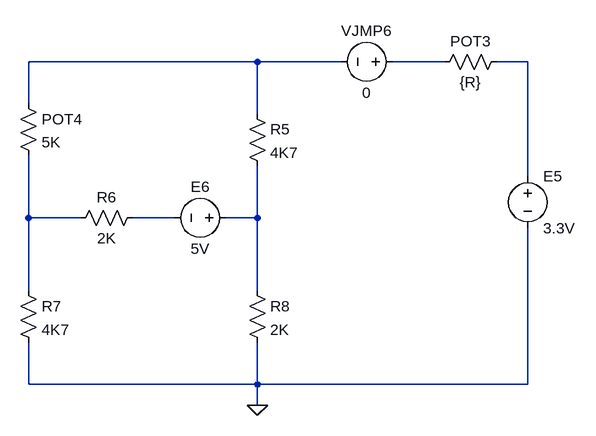
[diagram p0: schematic bai33.asc]
bai33.asc, the LTspice schematic file:
Version 4.1
SHEET 1 880 680
WIRE 144 -240 -208 -240
WIRE 272 -240 144 -240
WIRE 432 -240 352 -240
WIRE 560 -240 512 -240
WIRE -208 -176 -208 -240
WIRE 144 -160 144 -240
WIRE 560 -64 560 -240
WIRE -208 0 -208 -96
WIRE -128 0 -208 0
WIRE 16 0 -48 0
WIRE 144 0 144 -80
WIRE 144 0 96 0
WIRE -208 112 -208 0
WIRE 144 112 144 0
WIRE -208 256 -208 192
WIRE 144 256 144 192
WIRE 144 256 -208 256
WIRE 560 256 560 16
WIRE 560 256 144 256
WIRE 144 288 144 256
FLAG 144 288 0
SYMBOL res -224 -192 R0
SYMATTR InstName POT4
SYMATTR Value 5K
SYMBOL res 128 -176 R0
SYMATTR InstName R5
SYMATTR Value 4K7
SYMBOL res -32 -16 R90
WINDOW 0 0 56 VBottom 2
WINDOW 3 32 56 VTop 2
SYMATTR InstName R6
SYMATTR Value 2K
SYMBOL res -224 96 R0
SYMATTR InstName R7
SYMATTR Value 4K7
SYMBOL res 128 96 R0
SYMATTR InstName R8
SYMATTR Value 2K
SYMBOL res 528 -256 R90
WINDOW 0 0 56 VBottom 2
WINDOW 3 32 56 VTop 2
SYMATTR InstName POT3
SYMATTR Value {R}
SYMBOL voltage 368 -240 R90
WINDOW 0 -32 56 VBottom 2
WINDOW 3 32 56 VTop 2
WINDOW 123 0 0 Left 0
WINDOW 39 0 0 Left 0
SYMATTR InstName VJMP6
SYMATTR Value 0
SYMBOL voltage 560 -80 R0
WINDOW 123 0 0 Left 0
WINDOW 39 0 0 Left 0
SYMATTR InstName E5
SYMATTR Value 3.3V
SYMBOL voltage 112 0 R90
WINDOW 0 -32 56 VBottom 2
WINDOW 3 32 56 VTop 2
WINDOW 123 0 0 Left 0
WINDOW 39 0 0 Left 0
SYMATTR InstName E6
SYMATTR Value 5V

The netlist it stands for:
* bai33.asc
R§POT4 N001 N004 5K
R5 N001 N006 4K7
R6 N005 N004 2K
R7 N004 0 4K7
R8 N006 0 2K
R§POT3 N003 N002 {R}
VJMP6 N002 N001 0
V§E5 N003 0 3.3V
V§E6 N006 N005 5V
.backanno
.end